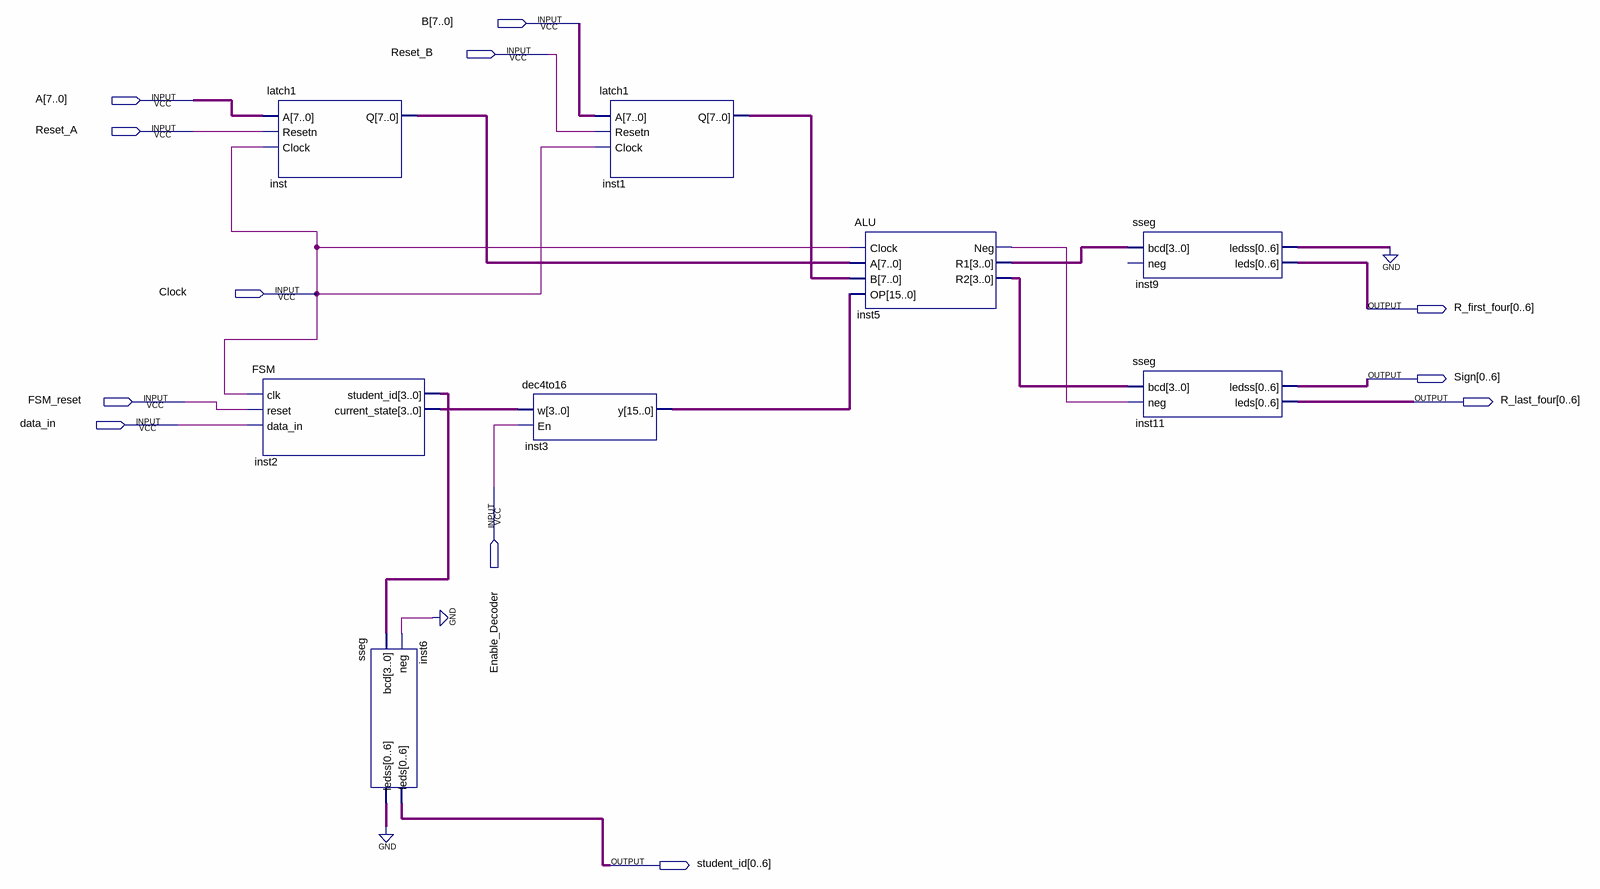
[diagram p0: schematic sheet]
// Quartus schematic Lab6.bdf as structural Verilog: 8 symbols, 12 pins
module Lab6 (
  input  [7:0] B,
  input  Reset_B,
  input  [7:0] A,
  input  Reset_A,
  input  Clock,
  input  FSM_reset,
  input  data_in,
  input  Enable_Decoder,
  output [0:6] R_first_four,
  output [0:6] Sign,
  output [0:6] R_last_four,
  output [0:6] student_id
);

  wire inst5_neg;
  wire [3:0] inst2_current_state, inst2_student_id, inst5_r1, inst5_r2;
  wire [6:0] inst6_ledss, inst9_ledss;
  wire [7:0] inst1_q, inst_q;
  wire [15:0] inst3_y;

  latch1 inst (.A(A), .Resetn(Reset_A), .Clock(Clock), .Q(inst_q));
  FSM inst2 (
    .clk(Clock), .reset(FSM_reset), .data_in(data_in), .student_id(inst2_student_id),
    .current_state(inst2_current_state));
  sseg inst6 (.bcd(inst2_student_id), .neg(1'b0), .ledss(inst6_ledss), .leds(student_id));
  dec4to16 inst3 (.w(inst2_current_state), .En(Enable_Decoder), .y(inst3_y));
  latch1 inst1 (.A(B), .Resetn(Reset_B), .Clock(Clock), .Q(inst1_q));
  ALU inst5 (.Clock(Clock), .A(inst_q), .B(inst1_q), .OP(inst3_y), .Neg(inst5_neg), .R1(inst5_r1), .R2(inst5_r2));
  sseg inst9 (.bcd(inst5_r1), .ledss(inst9_ledss), .leds(R_first_four));  // open: neg
  sseg inst11 (.bcd(inst5_r2), .neg(inst5_neg), .ledss(Sign), .leds(R_last_four));
  // also tied to GND on the sheet: {inst6_ledss[0], inst6_ledss[1], inst6_ledss[2], inst6_ledss[3], inst6_ledss[4], inst6_ledss[5], inst6_ledss[6], inst9_ledss[0], inst9_ledss[1], inst9_ledss[2], inst9_ledss[3], inst9_ledss[4], inst9_ledss[5], inst9_ledss[6]}
endmodule
